# Altium schematic sheet Проц, ввод вывод, питание.SchDoc
size 594 x 420 mm; CheckedBy: Проверил; _List: 2
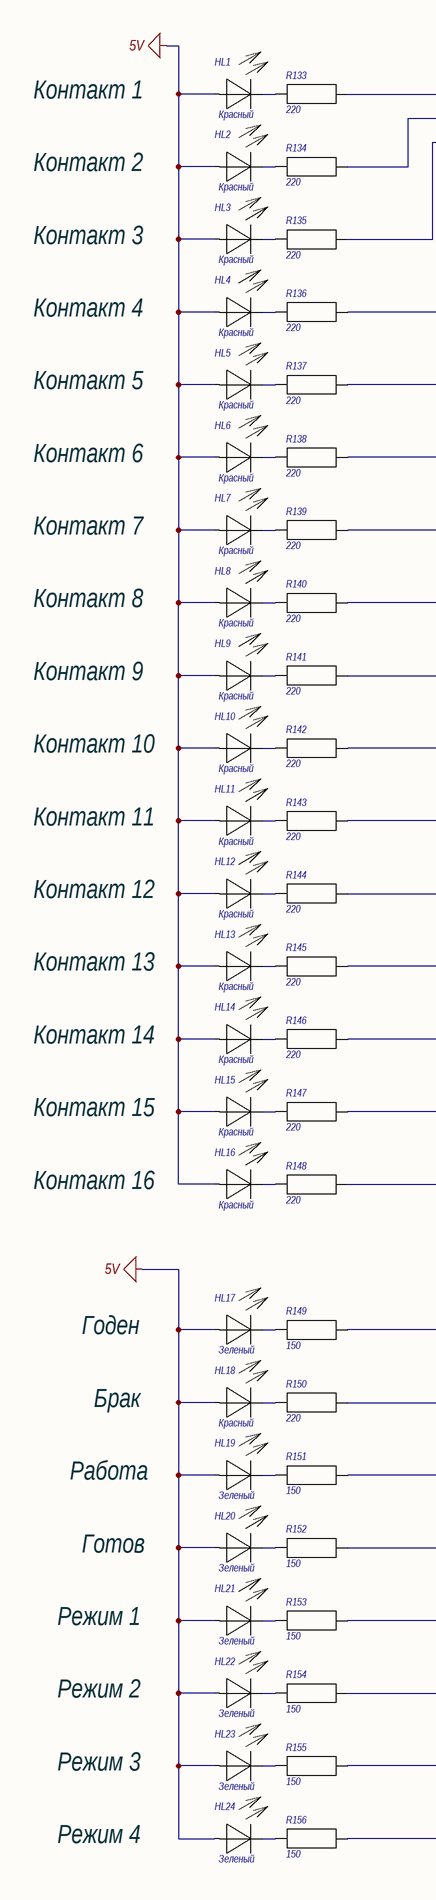
[diagram p0: Проц, ввод вывод, питание.SchDoc, left]
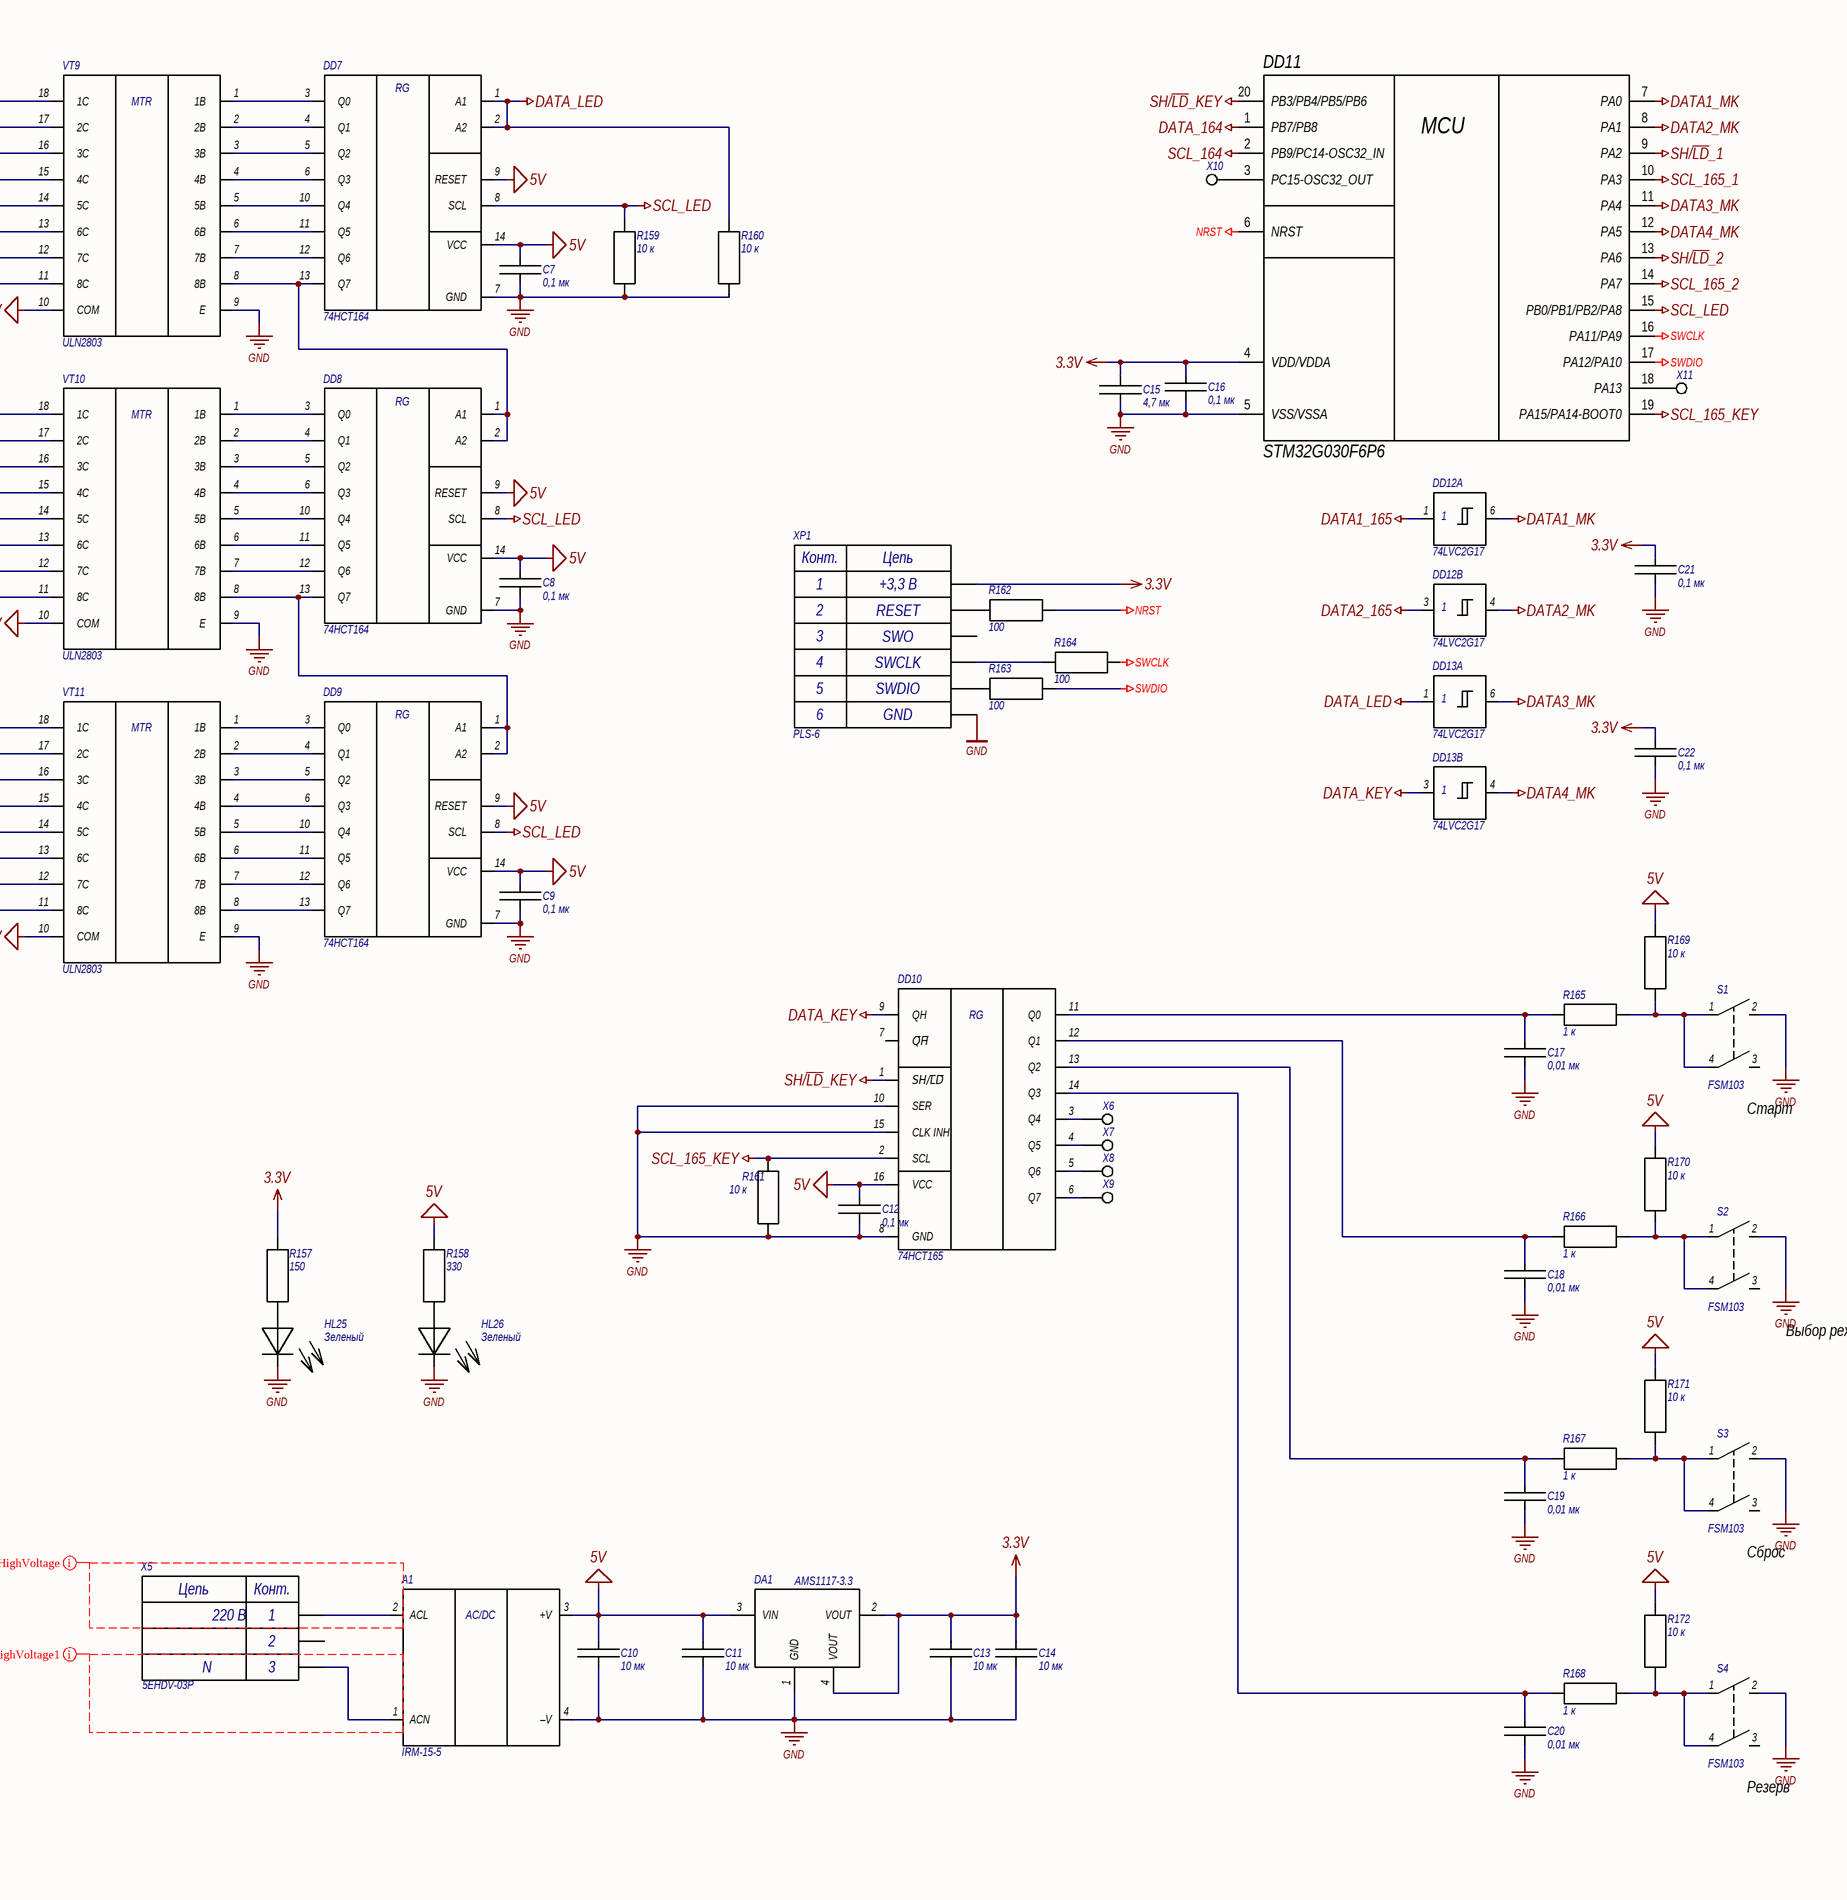
[diagram p1: Проц, ввод вывод, питание.SchDoc, right]

## Parts
A1  IRM-15-5  [IRM-15-5]
C7  0,1 мк  [CCAP0603]
C8  0,1 мк  [CCAP0603]
C9  0,1 мк  [CCAP0603]
C10  10 мк  [CCAP0603]
C11  10 мк  [CCAP0603]
C12  0,1 мк  [CCAP0603]
C13  10 мк  [CCAP0603]
C14  10 мк  [CCAP0603]
C15  4,7 мк  [CCAP0603]
C16  0,1 мк  [CCAP0603]
C17  0,01 мк  [CCAP0603]
C18  0,01 мк  [CCAP0603]
C19  0,01 мк  [CCAP0603]
C20  0,01 мк  [CCAP0603]
C21  0,1 мк  [CCAP0603]
C22  0,1 мк  [CCAP0603]
DA1  AMS1117-3.3  [SOT223-4 6.5x3.5]  (no BOM)
DD7  74HCT164  [SOIC14 8.6x3.9]
DD8  74HCT164  [SOIC14 8.6x3.9]
DD9  74HCT164  [SOIC14 8.6x3.9]
DD10  74HCT165  [SOIC16 9.9x3.9]
DD11  STM32G030F6P6  [TSSOP-20 (6.5x4.4)]
DD12  74LVC2G17  [SOT23-6 2.9x1.6]  (parts A,B of 2)
DD13  74LVC2G17  [SOT23-6 2.9x1.6]  (parts A,B of 2)
HL1  Красный  [LED RED 5MM]
HL2  Красный  [LED RED 5MM]
HL3  Красный  [LED RED 5MM]
HL4  Красный  [LED RED 5MM]
HL5  Красный  [LED RED 5MM]
HL6  Красный  [LED RED 5MM]
HL7  Красный  [LED RED 5MM]
HL8  Красный  [LED RED 5MM]
HL9  Красный  [LED RED 5MM]
HL10  Красный  [LED RED 5MM]
HL11  Красный  [LED RED 5MM]
HL12  Красный  [LED RED 5MM]
HL13  Красный  [LED RED 5MM]
HL14  Красный  [LED RED 5MM]
HL15  Красный  [LED RED 5MM]
HL16  Красный  [LED RED 5MM]
HL17  Зеленый  [LED GREEN 5MM]
HL18  Красный  [LED RED 5MM]
HL19  Зеленый  [LED GREEN 5MM]
HL20  Зеленый  [LED GREEN 5MM]
HL21  Зеленый  [LED GREEN 5MM]
HL22  Зеленый  [LED GREEN 5MM]
HL23  Зеленый  [LED GREEN 5MM]
HL24  Зеленый  [LED GREEN 5MM]
HL25  Зеленый  [LED GREEN 5MM]
HL26  Зеленый  [LED GREEN 5MM]
R133  220  [RES0805]
R134  220  [RES0805]
R135  220  [RES0805]
R136  220  [RES0805]
R137  220  [RES0805]
R138  220  [RES0805]
R139  220  [RES0805]
R140  220  [RES0805]
R141  220  [RES0805]
R142  220  [RES0805]
R143  220  [RES0805]
R144  220  [RES0805]
R145  220  [RES0805]
R146  220  [RES0805]
R147  220  [RES0805]
R148  220  [RES0805]
R149  150  [RES0805]
R150  220  [RES0805]
R151  150  [RES0805]
R152  150  [RES0805]
R153  150  [RES0805]
R154  150  [RES0805]
R155  150  [RES0805]
R156  150  [RES0805]
R157  150  [RES0805]
R158  330  [RES0805]
R159  10 к  [RES0805]
R160  10 к  [RES0805]
R161  10 к  [RES0805]
R162  100  [RES0603]
R163  100  [RES0603]
R164  100  [RES0603]
R165  1 к  [RES0805]
R166  1 к  [RES0805]
R167  1 к  [RES0805]
R168  1 к  [RES0805]
R169  10 к  [RES0805]
R170  10 к  [RES0805]
R171  10 к  [RES0805]
R172  10 к  [RES0805]
S1  FSM103  [PBUT3]
S2  FSM103  [PBUT3]
S3  FSM103  [PBUT3]
S4  FSM103  [PBUT3]
VT9  ULN2803  [IC_ULN2803ADW]
VT10  ULN2803  [IC_ULN2803ADW]
VT11  ULN2803  [IC_ULN2803ADW]
X5  5EHDV-03P  [MSTB3]
X6  (no value)  [Контакт 0,8 мм]  (no BOM)
X7  (no value)  [Контакт 0,8 мм]  (no BOM)
X8  (no value)  [Контакт 0,8 мм]  (no BOM)
X9  (no value)  [Контакт 0,8 мм]  (no BOM)
X10  (no value)  [Контакт 0,8 мм]  (no BOM)
X11  (no value)  [Контакт 0,8 мм]  (no BOM)
XP1  PLS-6  [PLS-6]

## Nets
3.3V: C13.1 C14.1 C15.2 C16.1 C21.1 C22.1 DA1.2(VOUT) DA1.4(VOUT) DD11.4(VDD/VDDA) R157.1 XP1.1
5V: A1.3(+V) C7.1 C8.1 C9.1 C10.1 C11.1 C12.1 DA1.3(VIN) DD7.9(RESET) DD7.14(VCC) DD8.9(RESET) DD8.14(VCC) DD9.9(RESET) DD9.14(VCC) DD10.16(VCC) HL1.2(A) HL2.2(A) HL3.2(A) HL4.2(A) HL5.2(A) HL6.2(A) HL7.2(A) HL8.2(A) HL9.2(A) HL10.2(A) HL11.2(A) HL12.2(A) HL13.2(A) HL14.2(A) HL15.2(A) HL16.2(A) HL17.2(A) HL18.2(A) HL19.2(A) HL20.2(A) HL21.2(A) HL22.2(A) HL23.2(A) HL24.2(A) R158.1 R169.1 R170.1 R171.1 R172.1 VT9.10(COM) VT10.10(COM) VT11.10(COM)
DATA1_165: DD12.1(1A)
DATA1_MK: DD11.7(PA0) DD12.6(1Y)
DATA2_165: DD12.3(2A)
DATA2_MK: DD11.8(PA1) DD12.4(2Y)
DATA3_MK: DD11.11(PA4) DD13.6(1Y)
DATA4_MK: DD11.12(PA5) DD13.4(2Y)
DATA_164: DD11.1(PB7/PB8)
DATA_KEY: DD10.9(QH) DD13.3(2A)
DATA_LED: DD7.1(A1) DD7.2(A2) DD13.1(1A) R160.2
GND: A1.4(–V) C7.2 C8.2 C9.2 C10.2 C11.2 C12.2 C13.2 C14.2 C15.1 C16.2 C17.2 C18.2 C19.2 C20.2 C21.2 C22.2 DA1.1(GND) DD7.7(GND) DD8.7(GND) DD9.7(GND) DD10.8(GND) DD10.10(SER) DD10.15(CLK_INH) DD11.5(VSS/VSSA) HL25.1(C) HL26.1(C) R159.1 R160.1 R161.1 S1.2 S2.2 S3.2 S4.2 VT9.9(E) VT10.9(E) VT11.9(E) XP1.6
NRST: DD11.6(NRST) R162.2
SCL_164: DD11.2(PB9/PC14-OSC32_IN)
SCL_165_1: DD11.10(PA3)
SCL_165_2: DD11.14(PA7)
SCL_165_KEY: DD10.2(SCL) DD11.19(PA15/PA14-BOOT0) R161.2
SCL_LED: DD7.8(SCL) DD8.8(SCL) DD9.8(SCL) DD11.15(PB0/PB1/PB2/PA8) R159.2
SH/~{LD}_1: DD11.9(PA2)
SH/~{LD}_2: DD11.13(PA6)
SH/~{LD}_KEY: DD10.1(SH/L̅D̅) DD11.20(PB3/PB4/PB5/PB6)
SWCLK: DD11.16(PA11/PA9) R164.2
SWDIO: DD11.17(PA12/PA10) R163.2
NetA1_1: A1.1(ACN) X5.3
NetA1_2: A1.2(ACL) X5.1
NetC17_1: C17.1 DD10.11(Q0) R165.2
NetC18_1: C18.1 DD10.12(Q1) R166.2
NetC19_1: C19.1 DD10.13(Q2) R167.2
NetC20_1: C20.1 DD10.14(Q3) R168.2
NetDD7_3: DD7.3(Q0) VT9.1(1B)
NetDD7_4: DD7.4(Q1) VT9.2(2B)
NetDD7_5: DD7.5(Q2) VT9.3(3B)
NetDD7_6: DD7.6(Q3) VT9.4(4B)
NetDD7_10: DD7.10(Q4) VT9.5(5B)
NetDD7_11: DD7.11(Q5) VT9.6(6B)
NetDD7_12: DD7.12(Q6) VT9.7(7B)
NetDD7_13: DD7.13(Q7) DD8.1(A1) DD8.2(A2) VT9.8(8B)
NetDD8_3: DD8.3(Q0) VT10.1(1B)
NetDD8_4: DD8.4(Q1) VT10.2(2B)
NetDD8_5: DD8.5(Q2) VT10.3(3B)
NetDD8_6: DD8.6(Q3) VT10.4(4B)
NetDD8_10: DD8.10(Q4) VT10.5(5B)
NetDD8_11: DD8.11(Q5) VT10.6(6B)
NetDD8_12: DD8.12(Q6) VT10.7(7B)
NetDD8_13: DD8.13(Q7) DD9.1(A1) DD9.2(A2) VT10.8(8B)
NetDD9_3: DD9.3(Q0) VT11.1(1B)
NetDD9_4: DD9.4(Q1) VT11.2(2B)
NetDD9_5: DD9.5(Q2) VT11.3(3B)
NetDD9_6: DD9.6(Q3) VT11.4(4B)
NetDD9_10: DD9.10(Q4) VT11.5(5B)
NetDD9_11: DD9.11(Q5) VT11.6(6B)
NetDD9_12: DD9.12(Q6) VT11.7(7B)
NetDD9_13: DD9.13(Q7) VT11.8(8B)
NetDD10_3: DD10.3(Q4) X6.1
NetDD10_4: DD10.4(Q5) X7.1
NetDD10_5: DD10.5(Q6) X8.1
NetDD10_6: DD10.6(Q7) X9.1
NetDD11_3: DD11.3(PC15-OSC32_OUT) X10.1
NetDD11_18: DD11.18(PA13) X11.1
NetHL1_1: HL1.1(C) R133.2
NetHL2_1: HL2.1(C) R134.2
NetHL3_1: HL3.1(C) R135.2
NetHL4_1: HL4.1(C) R136.2
NetHL5_1: HL5.1(C) R137.2
NetHL6_1: HL6.1(C) R138.2
NetHL7_1: HL7.1(C) R139.2
NetHL8_1: HL8.1(C) R140.2
NetHL9_1: HL9.1(C) R141.2
NetHL10_1: HL10.1(C) R142.2
NetHL11_1: HL11.1(C) R143.2
NetHL12_1: HL12.1(C) R144.2
NetHL13_1: HL13.1(C) R145.2
NetHL14_1: HL14.1(C) R146.2
NetHL15_1: HL15.1(C) R147.2
NetHL16_1: HL16.1(C) R148.2
NetHL17_1: HL17.1(C) R149.2
NetHL18_1: HL18.1(C) R150.2
NetHL19_1: HL19.1(C) R151.2
NetHL20_1: HL20.1(C) R152.2
NetHL21_1: HL21.1(C) R153.2
NetHL22_1: HL22.1(C) R154.2
NetHL23_1: HL23.1(C) R155.2
NetHL24_1: HL24.1(C) R156.2
NetHL25_2: HL25.2(A) R157.2
NetHL26_2: HL26.2(A) R158.2
NetR133_1: R133.1 VT9.18(1C)
NetR134_1: R134.1 VT9.17(2C)
NetR135_1: R135.1 VT9.16(3C)
NetR136_1: R136.1 VT9.15(4C)
NetR137_1: R137.1 VT9.14(5C)
NetR138_1: R138.1 VT9.13(6C)
NetR139_1: R139.1 VT9.12(7C)
NetR140_1: R140.1 VT9.11(8C)
NetR141_1: R141.1 VT10.18(1C)
NetR142_1: R142.1 VT10.17(2C)
NetR143_1: R143.1 VT10.16(3C)
NetR144_1: R144.1 VT10.15(4C)
NetR145_1: R145.1 VT10.14(5C)
NetR146_1: R146.1 VT10.13(6C)
NetR147_1: R147.1 VT10.12(7C)
NetR148_1: R148.1 VT10.11(8C)
NetR149_1: R149.1 VT11.18(1C)
NetR150_1: R150.1 VT11.17(2C)
NetR151_1: R151.1 VT11.16(3C)
NetR152_1: R152.1 VT11.15(4C)
NetR153_1: R153.1 VT11.14(5C)
NetR154_1: R154.1 VT11.13(6C)
NetR155_1: R155.1 VT11.12(7C)
NetR156_1: R156.1 VT11.11(8C)
NetR162_1: R162.1 XP1.2
NetR163_1: R163.1 XP1.5
NetR164_1: R164.1 XP1.4
NetR165_1: R165.1 R169.2 S1.1 S1.4
NetR166_1: R166.1 R170.2 S2.1 S2.4
NetR167_1: R167.1 R171.2 S3.1 S3.4
NetR168_1: R168.1 R172.2 S4.1 S4.4

Not connected (* = marked no-connect by the designer): DD10 7(Q̅H̅); DD12 2(Vss) 5(Vdd); DD13 2(Vss) 5(Vdd); S1 3; S2 3; S3 3; S4 3; X5 2; XP1 3

## Layout directives
net class HighVoltage1; rule Creepage Distance [Distance constraint 2.5mm]: (no net found under the mark)
net class HighVoltage2; rule Creepage Distance [Distance constraint 2.5mm]: (no net found under the mark)

## Notes on the sheet
- Контакт 1
- Контакт 2
- Контакт 3
- Контакт 4
- Контакт 5
- Контакт 6
- Контакт 7
- (near XP1) +3,3 В
- (near XP1) RESET
- Контакт 8
- (near XP1) SWCLK
- (near XP1) SWO
- Контакт 9
- (near XP1) GND
- (near XP1) SWDIO
- Контакт 10
- Контакт 11
- Контакт 12
- Контакт 13
- Контакт 14
- (near S1) Старт
- Контакт 15
- Контакт 16
- Выбор режима
- Годен
- Брак
- Работа
- (near S3) Сброс
- N
- 220 В
- Готов
- Режим 1
- (near S4) Резерв
- Режим 2
- Режим 3
- Режим 4
- Перв. примен.
- Справ. №
- Подп. и дата
- Инв. № дубл.
- Взам. инв. №
- Инв. № подл.
- Лист
- Копировал
- Формат  A2
- (in symbol 3 pins (Right)) Цепь; Конт.
- (in symbol 6 pins (Left)) Конт.; Цепь
- (in symbol 74HC164) RG
- (in symbol 74HC165) RG
- (in symbol MFM-05) AC/DC
- (in symbol STM32G030F6P6) MCU
- (in symbol ULN2803) MTR

## Library data of the parts
A1 = MFM-05: IRM-15-5 (AC/DC преобразователь)
C7-C9 C12 C16 C21 C22 = Конденсатор: C0603 0,1 мкФ 50В X7R
C10 C11 C13 C14 = Конденсатор: C0603 10 мкФ 25В X5R
C15 = Конденсатор: C0603 4,7 мкФ 25В X5R
C17-C20 = Конденсатор: C0603 0,01 мкФ 25В X7R
DA1 = L7805CD
DD7-DD9 = 74HC164: 74HCT164D (SOIC-14)
DD10 = 74HC165: 74HCT165D (SOIC-16) /
DD11 = STM32G030F6P6: Manufacturer: STMicroelectronics(ST); Value: STM32G030F6P6; Price: 58; HelpURL: https://lcsc.com/product-detail/ST-Microelectronics_STMicroelectronics-STM32G030F6P6TR_C529330.html; Case: TSSOP-20
DD12 DD13 = 74LVC2G17: SN74LVC2G17DBVR
HL1-HL16 HL18 = Светодиод: GNL-5013ED-E
HL17 HL19-HL26 = Светодиод: GNL-5013GD
R133-R148 R150 = Резистор: R0805 220 Ом ±5%
R149 R151-R157 = Резистор: R0805 150 Ом ±5%
R158 = Резистор: R0805 330 Ом ±5%
R159-R161 R169-R172 = Резистор: R0805 10 кОм ±5%
R162-R164 = Резистор: R0603 100 Ом ±5%
R165-R168 = Резистор: R0805 1 кОм ±5%
S1-S4 = Кнопка 1
VT9-VT11 = ULN2803: ULN2803 (SOP-18W)
X5 = 3 pins (Right): 5EHDV-03P + 5ESDV-03P
X6-X11 = 1 pin
XP1 = 6 pins (Left)